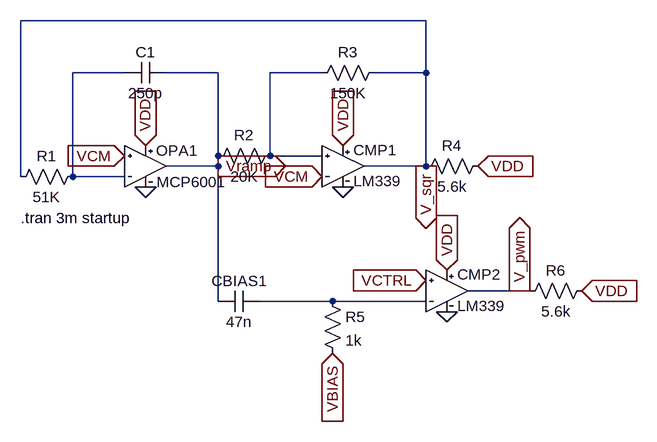
[diagram p0: schematic Exp1_block.asc]
Exp1_block.asc, the LTspice schematic file:
Version 4.1
SHEET 1 880 680
WIRE 288 -160 -336 -160
WIRE -176 -80 -256 -80
WIRE -32 -80 -112 -80
WIRE 128 -80 48 -80
WIRE 288 -80 288 -160
WIRE 288 -80 208 -80
WIRE -32 48 -32 -80
WIRE 48 48 48 -80
WIRE 128 48 48 48
WIRE -32 64 -32 48
WIRE -32 64 -112 64
WIRE 288 64 288 -80
WIRE 288 64 192 64
WIRE -336 80 -336 -160
WIRE -256 80 -256 -80
WIRE -176 80 -256 80
WIRE 432 256 352 256
WIRE 448 256 432 256
WIRE -32 272 -32 64
WIRE 144 272 32 272
WIRE 288 272 144 272
FLAG -176 48 VCM
IOPIN -176 48 In
FLAG -144 32 VDD
IOPIN -144 32 In
FLAG -144 96 0
FLAG 160 96 0
FLAG 160 32 VDD
IOPIN 160 32 In
FLAG 128 80 VCM
IOPIN 128 80 In
FLAG 320 224 VDD
IOPIN 320 224 In
FLAG 320 288 0
FLAG 288 240 VCTRL
IOPIN 288 240 In
FLAG 144 352 VBIAS
IOPIN 144 352 In
FLAG 368 64 VDD
IOPIN 368 64 In
FLAG 528 256 VDD
IOPIN 528 256 In
FLAG -32 64 Vramp
IOPIN -32 64 Out
FLAG 288 64 V_sqr
IOPIN 288 64 Out
FLAG 432 256 V_pwm
IOPIN 432 256 Out
SYMBOL MCP6001 -144 64 R0
SYMATTR InstName OPA1
SYMBOL cap -112 -96 R90
WINDOW 0 0 32 VBottom 2
WINDOW 3 32 32 VTop 2
SYMATTR InstName C1
SYMATTR Value 250p
SYMBOL res -240 64 R90
WINDOW 0 0 56 VBottom 2
WINDOW 3 32 56 VTop 2
SYMATTR InstName R1
SYMATTR Value 51K
SYMBOL res 64 32 R90
WINDOW 0 0 56 VBottom 2
WINDOW 3 32 56 VTop 2
SYMATTR InstName R2
SYMATTR Value 20K
SYMBOL LM339 192 64 R0
SYMATTR InstName CMP1
SYMBOL res 224 -96 R90
WINDOW 0 0 56 VBottom 2
WINDOW 3 32 56 VTop 2
SYMATTR InstName R3
SYMATTR Value 150K
SYMBOL res 384 48 R90
WINDOW 0 0 56 VBottom 2
WINDOW 3 32 56 VTop 2
SYMATTR InstName R4
SYMATTR Value 5.6k
SYMBOL LM339 352 256 R0
SYMATTR InstName CMP2
SYMBOL cap 32 256 R90
WINDOW 0 0 32 VBottom 2
WINDOW 3 32 32 VTop 2
SYMATTR InstName CBIAS1
SYMATTR Value 47n
SYMBOL res 128 256 R0
SYMATTR InstName R5
SYMATTR Value 1k
SYMBOL res 544 240 R90
WINDOW 0 0 56 VBottom 2
WINDOW 3 32 56 VTop 2
SYMATTR InstName R6
SYMATTR Value 5.6k
TEXT -336 144 Left 2 !.tran 3m startup

The netlist it stands for:
* Exp1_block.asc
X§OPA1 VCM N001 VDD 0 Vramp MCP6001
C1 Vramp N001 250p
R1 N001 V_sqr 51K
R2 N002 Vramp 20K
X§CMP1 N002 VCM VDD 0 V_sqr LM339
R3 V_sqr N002 150K
R4 VDD V_sqr 5.6k
X§CMP2 VCTRL N003 VDD 0 V_pwm LM339
CBIAS1 N003 Vramp 47n
R5 N003 VBIAS 1k
R6 VDD V_pwm 5.6k
.tran 3m startup
.lib ./MCP6001.lib
.lib ./LM339.lib
.backanno
.end